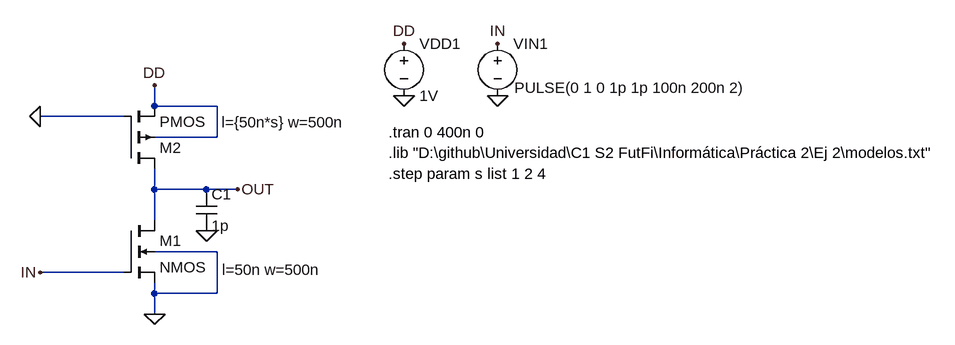
[diagram p0: schematic 4.asc]
4.asc, the LTspice schematic file:
Version 4
SHEET 1 1436 680
WIRE 112 32 112 0
WIRE 208 32 112 32
WIRE 64 48 -64 48
WIRE 208 80 208 32
WIRE 208 80 112 80
WIRE 112 160 112 128
WIRE 192 160 112 160
WIRE 240 160 192 160
WIRE 112 208 112 160
WIRE 208 256 112 256
WIRE 64 288 -64 288
WIRE 112 320 112 304
WIRE 208 320 208 256
WIRE 208 320 112 320
WIRE 112 352 112 320
FLAG 496 16 0
FLAG 640 16 0
FLAG 496 -64 DD
FLAG 640 -64 IN
FLAG 112 0 DD
FLAG 240 160 OUT
FLAG -64 288 IN
FLAG 112 352 0
FLAG -64 48 0
FLAG 192 224 0
SYMBOL nmos4 64 208 R0
WINDOW 123 152 76 Left 2
WINDOW 0 56 31 Left 2
SYMATTR Value2 l=50n w=500n
SYMATTR InstName M1
SYMBOL pmos4 64 128 M180
WINDOW 123 151 71 Left 2
SYMATTR Value2 l={50n*s} w=500n
SYMATTR InstName M2
SYMBOL voltage 496 -80 R0
SYMATTR InstName VDD1
SYMATTR Value 1V
SYMBOL voltage 640 -80 R0
WINDOW 123 0 0 Left 0
WINDOW 39 0 0 Left 0
WINDOW 3 26 84 Left 2
SYMATTR Value PULSE(0 1 0 1p 1p 100n 200n 2)
SYMATTR InstName VIN1
SYMBOL cap 176 160 R0
SYMATTR InstName C1
SYMATTR Value 1p
TEXT 472 104 Left 2 !.lib "D:\\github\\Universidad\\C1 S2 FutFi\\Informática\\Práctica 2\\Ej 2\\modelos.txt"
TEXT 472 72 Left 2 !.tran 0 400n 0
TEXT 472 136 Left 2 !.step param s list 1 2 4

The netlist it stands for:
* 4.asc
M1 OUT IN 0 0 NMOS l=50n w=500n
M2 OUT 0 DD DD PMOS l={50n*s} w=500n
VDD1 DD 0 1V
VIN1 IN 0 PULSE(0 1 0 1p 1p 100n 200n 2)
C1 OUT 0 1p
.model NMOS NMOS
.model PMOS PMOS
.lib standard.mos
.lib "D:\github\Universidad\C1 S2 FutFi\Informática\Práctica 2\Ej 2\modelos.txt"
.tran 0 400n 0
.step param s list 1 2 4
.backanno
.end